# Altium schematic sheet stspin32g4.SchDoc (part 3 of 3)
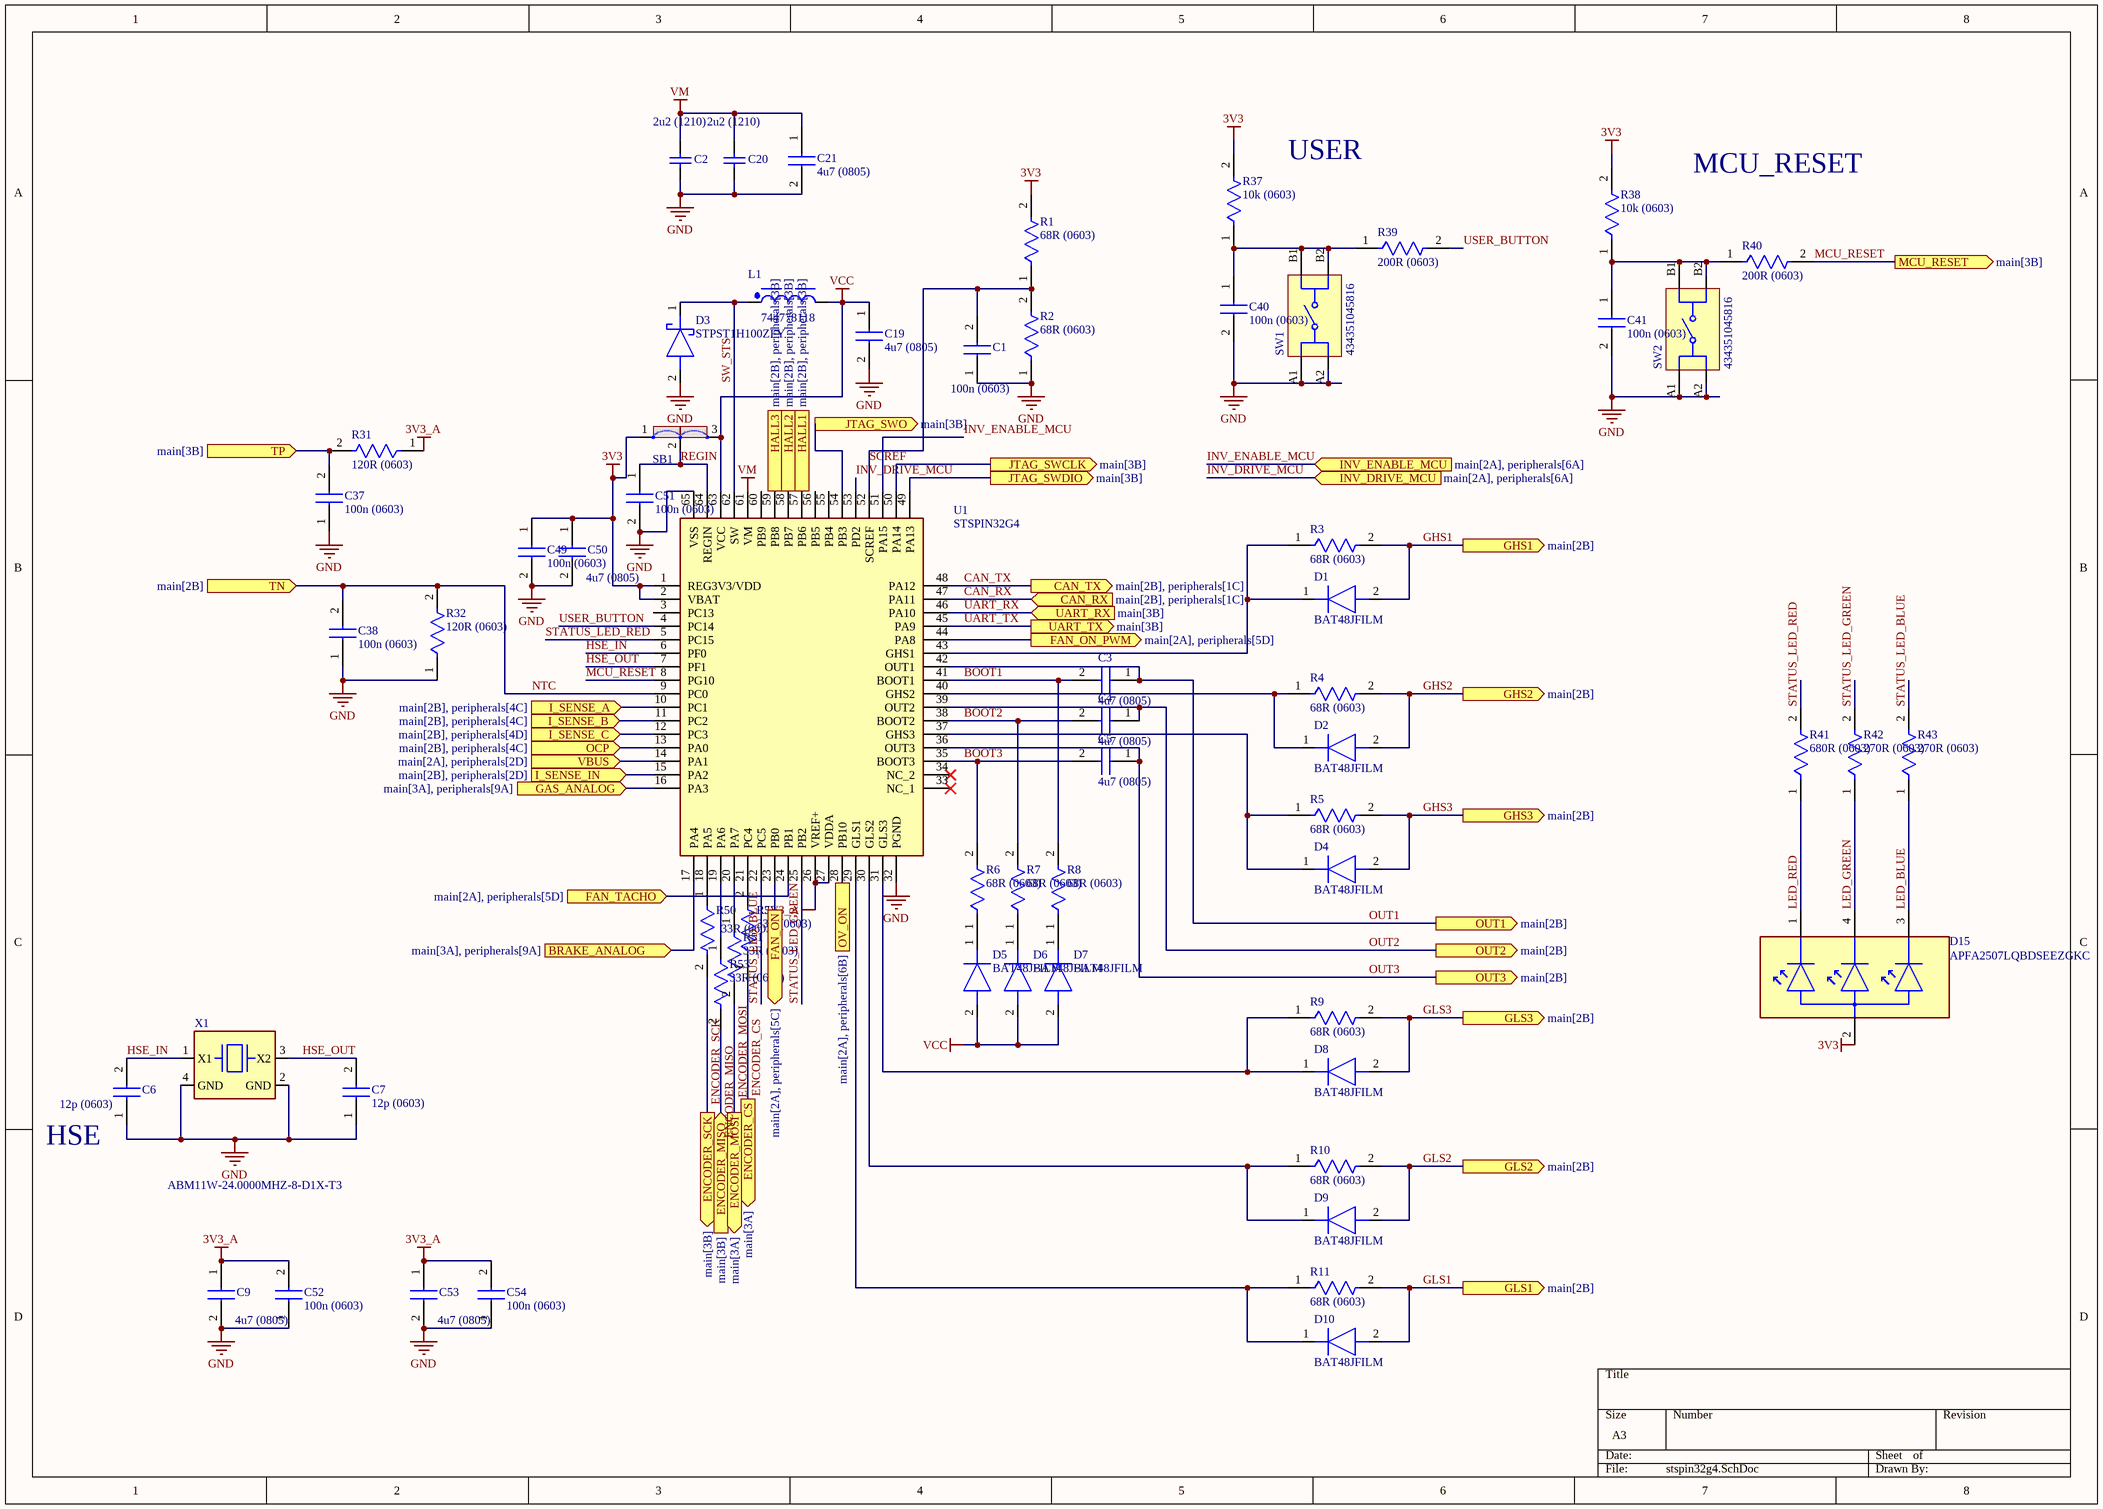
[diagram p2: stspin32g4.SchDoc]

## Library data of the parts (continued)
R50-R53 = RK73H1JTTD33R0F: Res Thick Film 0603 33 Ohm 1% 0.125W(1/8W) ±100ppm/C Pad SMD Automotive T/R; Manufacturer_Name: Yageo Group; Manufacturer_Part_Number: SR0603FR-7T10KL; Power Rating: 250mW; Value: 10kΩ; Temperature Coefficient: 100ppm/°C; Voltage Rating: 75V; Working Voltage: 150V; Voltage Rating (DC): 50V; Datasheet Link: https://mouser.componentsearchengine.com/Datasheets/1/SR0603FR-7T10KL.pdf; Height: 0.55mm; Mouser Part Number: 603-SR0603FR-7T10KL; Mouser Price/Stock: https://www.mouser.co.uk/ProductDetail/YAGEO/SR0603FR-7T10KL?qs=pfd5qewlna6IurLw3u3uRA%3D%3D; Arrow Part Number: SR0603FR-7T10KL; Arrow Price/Stock: https://www.arrow.com/en/products/sr0603fr-7t10kl/yageo; Supplier: DigiKey; Supplier Part Number: YAG5823CT-ND; Manufacturer: Yageo Group; Manufacturer Part Number: SR0603FR-7T10KL; RoHS: Compliant; Category: Chip SMD Resistors; Pricing: 1=0,67, 10=0,399, 25=0,3376, 50=0,3022, 100=0,2744, 250=0,24612, 500=0,22976, 1000=0,21675 (USD); Case/Package: 0603; China RoHS: Non-Compliant; Composition: Thick Film; Country of Origin: Mainland China, Taiwan; Export Control Classification Number (ECCN) Code: EAR99; Harmonized Tariff Schedule (HTS) Code: 8533.21.00.30; Introduction Date: 2017-10-02; Length: 1.6mm; Lifecycle Status: Production; Max Operating Temperature: 155°C; Min Operating Temperature: -55°C; Mounting Technology: Surface Mount; Number of Terminals: 2; Packaging: Tape & Reel; Ratings: AEC-Q200; REACH SVHC: Yes; Tolerance: 1%; Width: 800µm; ComponentLink1URL: https://datasheet.octopart.com:443/SR0603FR-7T10KL-Yageo-datasheet-176402240.pdf?src-supplier=Farnell; ComponentLink1Description: https://datasheet.octopart.com:443/SR0603FR-7T10KL-Yageo-datasheet-176402240.pdf?src-supplier=Farnell; ComponentLink2URL: https://datasheet.octopart.com:443/SR0603FR-7T10KL-Yageo-datasheet-119732217.pdf?src-supplier=Upverter; ComponentLink2Description: https://datasheet.octopart.com:443/SR0603FR-7T10KL-Yageo-datasheet-119732217.pdf?src-supplier=Upverter; ComponentLink3URL: https://datasheet.octopart.com:443/SR0603FR-7T10KL-Yageo-Group-datasheet-184785656.pdf?src-supplier=Future+Electronics; ComponentLink3Description: https://datasheet.octopart.com:443/SR0603FR-7T10KL-Yageo-Group-datasheet-184785656.pdf?src-supplier=Future+Electronics; ComponentLink4URL: https://datasheet.octopart.com:443/SR0603FR-7T10KL-Yageo-datasheet-155675517.pdf?src-supplier=Future+Electronics; ComponentLink4Description: https://datasheet.octopart.com:443/SR0603FR-7T10KL-Yageo-datasheet-155675517.pdf?src-supplier=Future+Electronics; ComponentLink5URL: https://datasheet.octopart.com:443/SR0603FR-7T10KL-Yageo-datasheet-137701088.pdf?src-supplier=Future+Electronics; ComponentLink5Description: https://datasheet.octopart.com:443/SR0603FR-7T10KL-Yageo-datasheet-137701088.pdf?src-supplier=Future+Electronics; ComponentLink6URL: https://datasheet.octopart.com/SR0603FR-7T10KL-Yageo-datasheet-11047080.pdf; ComponentLink6Description: https://datasheet.octopart.com/SR0603FR-7T10KL-Yageo-datasheet-11047080.pdf; ComponentLink7URL: http://sigma.octopart.com:80/conflict_mineral_statement/Yageo-company-3.pdf?src-supplier=Compliance+Statements; ComponentLink7Description: http://sigma.octopart.com:80/conflict_mineral_statement/Yageo-company-3.pdf?src-supplier=Compliance+Statements; ComponentLink8URL: http://sigma.octopart.com:80/rohs_statement/Yageo-company-2.pdf?src-supplier=Compliance+Statements; ComponentLink8Description: http://sigma.octopart.com:80/rohs_statement/Yageo-company-2.pdf?src-supplier=Compliance+Statements; Stock: 5000; ComponentLink9URL: https://datasheet.octopart.com:443/SR0603FR-7T4R7L-Yageo-datasheet-176402240.pdf?src-supplier=Farnell; ComponentLink9Description: https://datasheet.octopart.com:443/SR0603FR-7T4R7L-Yageo-datasheet-176402240.pdf?src-supplier=Farnell; ComponentLink10URL: https://datasheet.octopart.com:443/SR0603FR-7T4R7L-Yageo-datasheet-119732217.pdf?src-supplier=Upverter; ComponentLink10Description: https://datasheet.octopart.com:443/SR0603FR-7T4R7L-Yageo-datasheet-119732217.pdf?src-supplier=Upverter; ComponentLink11URL: https://datasheet.octopart.com:443/SR0603FR-7T4R7L-Yageo-Group-datasheet-184785656.pdf?src-supplier=Future+Electronics; ComponentLink11Description: https://datasheet.octopart.com:443/SR0603FR-7T4R7L-Yageo-Group-datasheet-184785656.pdf?src-supplier=Future+Electronics; ComponentLink12URL: https://datasheet.octopart.com:443/SR0603FR-7T4R7L-Yageo-datasheet-155675517.pdf?src-supplier=Future+Electronics; ComponentLink12Description: https://datasheet.octopart.com:443/SR0603FR-7T4R7L-Yageo-datasheet-155675517.pdf?src-supplier=Future+Electronics; ComponentLink13URL: https://datasheet.octopart.com:443/SR0603FR-7T4R7L-Yageo-datasheet-137701088.pdf?src-supplier=Future+Electronics; ComponentLink13Description: https://datasheet.octopart.com:443/SR0603FR-7T4R7L-Yageo-datasheet-137701088.pdf?src-supplier=Future+Electronics; ComponentLink14URL: https://datasheet.octopart.com/SR0603FR-7T4R7L-Yageo-datasheet-11047080.pdf; ComponentLink14Description: https://datasheet.octopart.com/SR0603FR-7T4R7L-Yageo-datasheet-11047080.pdf; Schedule B: 8533210045, 8533210045|8533210045|8533210045|8533210045|8533210045; ComponentLink15URL: https://datasheet.octopart.com:443/SR0603FR-7T100KL-Yageo-datasheet-176402240.pdf?src-supplier=element14+APAC; ComponentLink15Description: https://datasheet.octopart.com:443/SR0603FR-7T100KL-Yageo-datasheet-176402240.pdf?src-supplier=element14+APAC; ComponentLink16URL: https://datasheet.octopart.com:443/SR0603FR-7T100KL-Yageo-datasheet-119732217.pdf?src-supplier=Upverter; ComponentLink16Description: https://datasheet.octopart.com:443/SR0603FR-7T100KL-Yageo-datasheet-119732217.pdf?src-supplier=Upverter; ComponentLink17URL: https://datasheet.octopart.com:443/SR0603FR-7T100KL-Yageo-Group-datasheet-184785656.pdf?src-supplier=Future+Electronics; ComponentLink17Description: https://datasheet.octopart.com:443/SR0603FR-7T100KL-Yageo-Group-datasheet-184785656.pdf?src-supplier=Future+Electronics; ComponentLink18URL: https://datasheet.octopart.com:443/SR0603FR-7T100KL-Yageo-datasheet-155675517.pdf?src-supplier=Future+Electronics; ComponentLink18Description: https://datasheet.octopart.com:443/SR0603FR-7T100KL-Yageo-datasheet-155675517.pdf?src-supplier=Future+Electronics; ComponentLink19URL: https://datasheet.octopart.com:443/SR0603FR-7T100KL-Yageo-datasheet-137701088.pdf?src-supplier=Future+Electronics; ComponentLink19Description: https://datasheet.octopart.com:443/SR0603FR-7T100KL-Yageo-datasheet-137701088.pdf?src-supplier=Future+Electronics; ComponentLink20URL: https://datasheet.octopart.com/SR0603FR-7T100KL-Yageo-datasheet-11047080.pdf; ComponentLink20Description: https://datasheet.octopart.com/SR0603FR-7T100KL-Yageo-datasheet-11047080.pdf; Case Code (Imperial): 0603; Case Code (Metric): 1608; Depth: 800µm; Lead Free: Lead Free; Military Standard: Not; Pins: 2; Termination: SMD/SMT; ComponentLink21URL: https://datasheet.octopart.com:443/RK73H1JTTD1001F-KOA-Speer-datasheet-181956035.pdf?src-supplier=IHS; ComponentLink21Description: https://datasheet.octopart.com:443/RK73H1JTTD1001F-KOA-Speer-datasheet-181956035.pdf?src-supplier=IHS; ComponentLink22URL: https://datasheet.octopart.com/RK73H1JTTD1001F-KOA-Speer-datasheet-11590619.pdf; ComponentLink22Description: https://datasheet.octopart.com/RK73H1JTTD1001F-KOA-Speer-datasheet-11590619.pdf; ComponentLink23URL: https://datasheet.octopart.com:443/RK73H1JTTD1001F-KOA-Speer-datasheet-149653815.pdf?src-supplier=element14+APAC; ComponentLink23Description: https://datasheet.octopart.com:443/RK73H1JTTD1001F-KOA-Speer-datasheet-149653815.pdf?src-supplier=element14+APAC; ComponentLink24URL: https://datasheet.octopart.com:443/RK73H1JTTD1001F-KOA-Speer-datasheet-10854116.pdf?src-supplier=element14+APAC; ComponentLink24Description: https://datasheet.octopart.com:443/RK73H1JTTD1001F-KOA-Speer-datasheet-10854116.pdf?src-supplier=element14+APAC; ComponentLink25URL: https://datasheet.octopart.com:443/RK73H1JTTD1001F-KOA-Speer-datasheet-188906116.pdf?src-supplier=TME; ComponentLink25Description: https://datasheet.octopart.com:443/RK73H1JTTD1001F-KOA-Speer-datasheet-188906116.pdf?src-supplier=TME; ComponentLink26URL: https://datasheet.octopart.com:443/RK73H1JTTD1001F-KOA-Speer-datasheet-155997623.pdf?src-supplier=Future+Electronics; ComponentLink26Description: https://datasheet.octopart.com:443/RK73H1JTTD1001F-KOA-Speer-datasheet-155997623.pdf?src-supplier=Future+Electronics; ComponentLink27URL: https://datasheet.octopart.com:443/RK73H1JTTD1001F-KOA-Speer-datasheet-11541643.pdf?src-supplier=Arrow+Electronics; ComponentLink27Description: https://datasheet.octopart.com:443/RK73H1JTTD1001F-KOA-Speer-datasheet-11541643.pdf?src-supplier=Arrow+Electronics; ComponentLink28URL: https://datasheet.octopart.com:443/RK73H1JTTD1001F-KOA-Speer-datasheet-5377369.pdf?src-supplier=Garrett; ComponentLink28Description: https://datasheet.octopart.com:443/RK73H1JTTD1001F-KOA-Speer-datasheet-5377369.pdf?src-supplier=Garrett; ComponentLink29URL: https://datasheet.octopart.com:443/RK73H1JTTD1001F-KOA-Speer-datasheet-5377256.pdf?src-supplier=Garrett; ComponentLink29Description: https://datasheet.octopart.com:443/RK73H1JTTD1001F-KOA-Speer-datasheet-5377256.pdf?src-supplier=Garrett; ComponentLink30URL: https://datasheet.octopart.com:443/RK73H1JTTD1001F-KOA-Speer-datasheet-109233.pdf?src-supplier=Garrett; ComponentLink30Description: https://datasheet.octopart.com:443/RK73H1JTTD1001F-KOA-Speer-datasheet-109233.pdf?src-supplier=Garrett; ComponentLink31URL: https://datasheet.octopart.com:443/RK73H1JTTD1001F-KOA-Speer-datasheet-5313488.pdf?src-supplier=Verical; ComponentLink31Description: https://datasheet.octopart.com:443/RK73H1JTTD1001F-KOA-Speer-datasheet-5313488.pdf?src-supplier=Verical; ComponentLink32URL: http://sigma.octopart.com:80/rohs_statement/KOA-Speer-company-17.pdf?src-supplier=Compliance+Statements; ComponentLink32Description: http://sigma.octopart.com:80/rohs_statement/KOA-Speer-company-17.pdf?src-supplier=Compliance+Statements; ComponentLink33URL: https://datasheet.octopart.com:443/RK73H1JTTD33R0F-KOA-Speer-datasheet-181956035.pdf?src-supplier=IHS; ComponentLink33Description: https://datasheet.octopart.com:443/RK73H1JTTD33R0F-KOA-Speer-datasheet-181956035.pdf?src-supplier=IHS; ComponentLink34URL: https://datasheet.octopart.com:443/RK73H1JTTD33R0F-KOA-Speer-datasheet-11590619.pdf?src-supplier=Upverter; ComponentLink34Description: https://datasheet.octopart.com:443/RK73H1JTTD33R0F-KOA-Speer-datasheet-11590619.pdf?src-supplier=Upverter; ComponentLink35URL: https://datasheet.octopart.com:443/RK73H1JTTD33R0F-KOA-Speer-datasheet-149653815.pdf?src-supplier=element14+APAC; ComponentLink35Description: https://datasheet.octopart.com:443/RK73H1JTTD33R0F-KOA-Speer-datasheet-149653815.pdf?src-supplier=element14+APAC; ComponentLink36URL: https://datasheet.octopart.com:443/RK73H1JTTD33R0F-KOA-Speer-datasheet-10854116.pdf?src-supplier=element14+APAC; ComponentLink36Description: https://datasheet.octopart.com:443/RK73H1JTTD33R0F-KOA-Speer-datasheet-10854116.pdf?src-supplier=element14+APAC; ComponentLink37URL: https://datasheet.octopart.com:443/RK73H1JTTD33R0F-KOA-Speer-datasheet-188906116.pdf?src-supplier=TME; ComponentLink37Description: https://datasheet.octopart.com:443/RK73H1JTTD33R0F-KOA-Speer-datasheet-188906116.pdf?src-supplier=TME; ComponentLink38URL: https://datasheet.octopart.com:443/RK73H1JTTD33R0F-KOA-Speer-datasheet-164280812.pdf?src-supplier=Future+Electronics; ComponentLink38Description: https://datasheet.octopart.com:443/RK73H1JTTD33R0F-KOA-Speer-datasheet-164280812.pdf?src-supplier=Future+Electronics
SW1 SW2 = CMP-1461-00002-5: Switch Tactile N.O. SPST Rectangular Button Gull Wing 0.05A 12VDC 200000Cycles 1.57N SMD T/R; Contact Resistance: 100mΩ; Life (Cycles): 200kcycles; Operating Force: 1.6N; Contact Current Rating: 50mA; Voltage Rating (DC): 12V; Insulation Resistance: 100MΩ; Max Operating Temperature: 85°C; Mount: Surface Mount; RoHS: Compliant; Width: 4.7mm; Height: 1.65mm; Packaging: Tape and Reel; Contact Plating: Silver; Min Operating Temperature: -40°C; Current Rating: 50mA; Voltage Rating: 12V
U1 = STSPIN32G4: Integrated Circuit; Manufacturer_Name: STMicroelectronics; Datasheet Link: https://www.st.com/resource/en/datasheet/stspin32g4.pdf; Height: 1mm; Manufacturer_Part_Number: STSPIN32G4; Mouser Part Number: 511-STSPIN32G4; Mouser Price/Stock: https://www.mouser.co.uk/ProductDetail/STMicroelectronics/STSPIN32G4?qs=DRkmTr78QAT8JT82Qbof2g%3D%3D; Arrow Part Number: STSPIN32G4; Arrow Price/Stock: https://www.arrow.com/en/products/stspin32g4/stmicroelectronics.html?utm_currency=USD&region=nac
X1 = ABM11W-24.0000MHZ-8-D1X-T3: Crystal, Quartz, 24 MHz, SMD, 2mm x 1.6mm x 0.5mm, 20 ppm, 8 pF, 10 ppm, ABM11W; Manufacturer: Abracon; MF: Abracon LLC; ESR (Equivalent Series Resistance): 100Ω; Frequency: 24MHz; Frequency Stability: 20ppm; Frequency Tolerance: 0.001%; Load Capacitance: 8pF; ESR: 30Ω; SnapEDA_Link: https://www.snapeda.com/parts/ABM11W-24.0000MHZ-8-D1X-T3/Abracon/view-part/?ref=snap; Package: SMD-4 Abracon LLC; Value: *; MP: ABM11W-24.0000MHZ-8-D1X-T3; Check_prices: https://www.snapeda.com/parts/ABM11W-24.0000MHZ-8-D1X-T3/Abracon/view-part/?ref=eda; Supplier: DigiKey; Supplier Part Number: 535-13835-1-ND; Manufacturer Part Number: ABM11W-24.0000MHZ-8-D1X-T3; RoHS: Compliant; Category: Crystals; Stock: 2752; Pricing: 1=0,38, 10=0,334, 25=0,3156, 50=0,3024, 100=0,29, 250=0,27424, 500=0,26288, 1000=0,25201 (USD); China RoHS: Compliant; Height: 500µm; Length: 2mm; Lifecycle Status: Production; Max Operating Temperature: 85°C; Min Operating Temperature: -40°C; Mounting Technology: Surface Mount; REACH SVHC: Yes; Tolerance: 0.001%; Width: 1.6mm; ComponentLink1URL: https://datasheet.octopart.com:443/ABM11W-24.0000MHZ-8-D1X-T3-Abracon-datasheet-154833168.pdf?src-supplier=IHS; ComponentLink1Description: https://datasheet.octopart.com:443/ABM11W-24.0000MHZ-8-D1X-T3-Abracon-datasheet-154833168.pdf?src-supplier=IHS; ComponentLink2URL: https://datasheet.octopart.com:443/ABM11W-24.0000MHZ-8-D1X-T3-Abracon-datasheet-102760955.pdf?src-supplier=Upverter; ComponentLink2Description: https://datasheet.octopart.com:443/ABM11W-24.0000MHZ-8-D1X-T3-Abracon-datasheet-102760955.pdf?src-supplier=Upverter; ComponentLink3URL: https://datasheet.octopart.com:443/ABM11W-24.0000MHZ-8-D1X-T3-Abracon-datasheet-112015802.pdf?src-supplier=Master+Electronics; ComponentLink3Description: https://datasheet.octopart.com:443/ABM11W-24.0000MHZ-8-D1X-T3-Abracon-datasheet-112015802.pdf?src-supplier=Master+Electronics; ComponentLink4URL: https://datasheet.octopart.com:443/ABM11W-24.0000MHZ-8-D1X-T3-Abracon-datasheet-182204996.pdf?src-supplier=Master+Electronics; ComponentLink4Description: https://datasheet.octopart.com:443/ABM11W-24.0000MHZ-8-D1X-T3-Abracon-datasheet-182204996.pdf?src-supplier=Master+Electronics; ComponentLink5URL: https://sigma.octopart.com:443/141159858/technical_drawing/Abracon-ABM11W-24.0000MHZ-8-D1X-T3.pdf?src-supplier=Abracon+SCT; ComponentLink5Description: https://sigma.octopart.com:443/141159858/technical_drawing/Abracon-ABM11W-24.0000MHZ-8-D1X-T3.pdf?src-supplier=Abracon+SCT; ComponentLink6URL: http://sigma.octopart.com:80/conflict_mineral_statement/Abracon-company-27.pdf?src-supplier=Compliance+Statements; ComponentLink6Description: http://sigma.octopart.com:80/conflict_mineral_statement/Abracon-company-27.pdf?src-supplier=Compliance+Statements